# EAGLE design untitled (EAGLE 9.6.2)
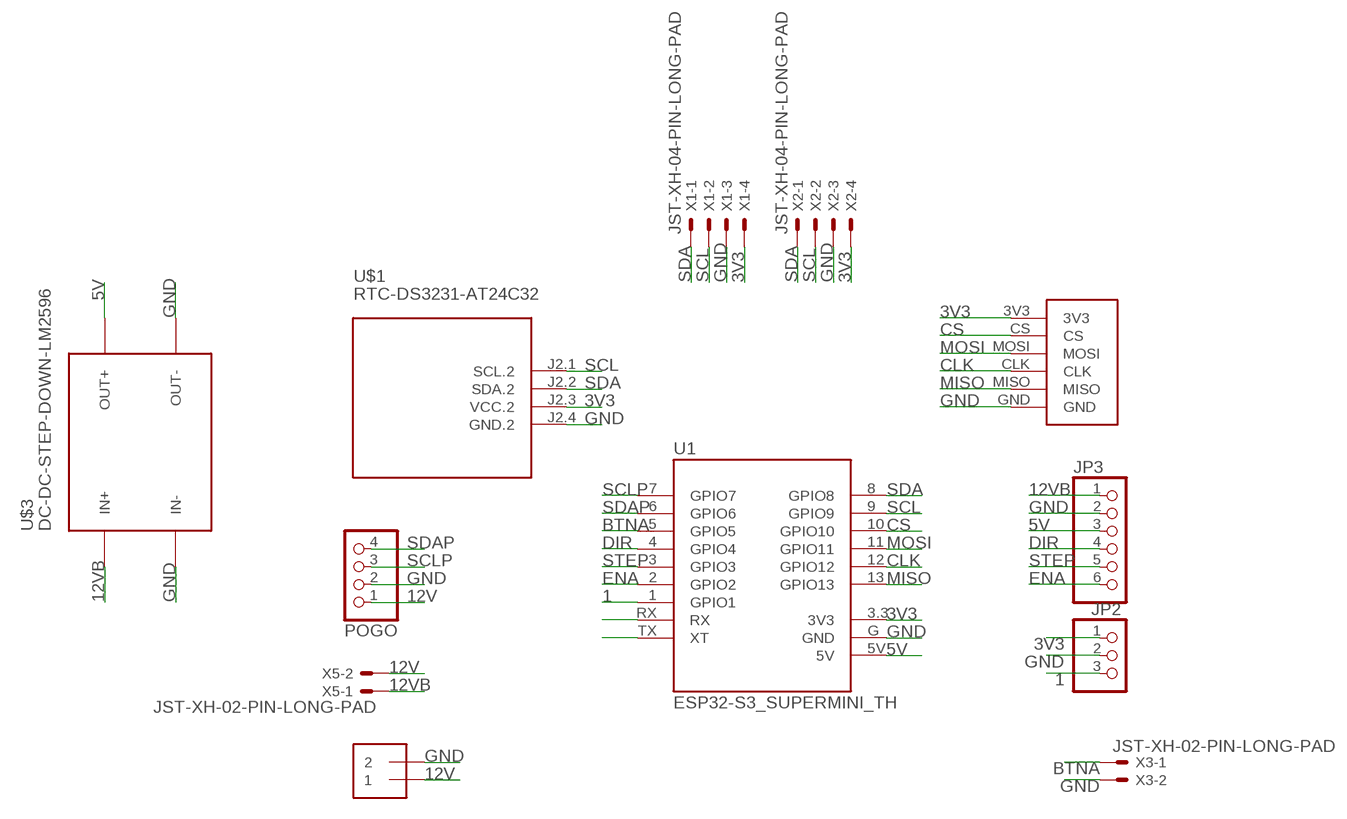
[diagram p0: schematic, sheet 1]

## Parts
J1  1X2-3.5MM  [1X2-3.5MM]
JP2  PINHD-1X3  [1X03]
JP3  PINHD-1X6  [1X06]
POGO  PINHD-1X4  [1X04]
U1  ESP32-S3_SUPERMINI_TH  [MODULE_ESP32-S3_SUPERMINI_TH]
U$1  RTC-DS3231-AT24C32  [RTC-DS3231-AT24C32]
U$2  SD_KUSKALLA  [SD_KUSKALLA]
U$3  DC-DC-STEP-DOWN-LM2596  [DC-DC-STEP-DOWN-LM2596]
X1  JST-XH-04-PIN-LONG-PAD  [JST-XH-04-PACKAGE-LONG-PAD]
X2  JST-XH-04-PIN-LONG-PAD  [JST-XH-04-PACKAGE-LONG-PAD]
X3  JST-XH-02-PIN-LONG-PAD  [JST-XH-02-PACKAGE-LONG-PAD]
X5  JST-XH-02-PIN-LONG-PAD  [JST-XH-02-PACKAGE-LONG-PAD]

## Nets
1: JP2.3 U1.1(GPIO1)
3V3: JP2.1 U1.3.3(3V3) U$1.J2.3(VCC.2) U$2.3V3 X1.4 X2.4
5V: JP3.3 U1.5V U$3.OUT+
12V: J1.1 POGO.1 X5.2
12VB: JP3.1 U$3.IN+ X5.1
BTNA: U1.5(GPIO5) X3.1
CLK: U1.12(GPIO12) U$2.CLK
CS: U1.10(GPIO10) U$2.CS
DIR: JP3.4 U1.4(GPIO4)
ENA: JP3.6 U1.2(GPIO2)
GND: J1.2 JP2.2 JP3.2 POGO.2 U1.G(GND) U$1.J2.4(GND.2) U$2.GND U$3.IN- U$3.OUT- X1.3 X2.3 X3.2
MISO: U1.13(GPIO13) U$2.MISO
MOSI: U1.11(GPIO11) U$2.MOSI
N$8: U1.RX
N$9: U1.TX(XT)
SCL: U1.9(GPIO9) U$1.J2.1(SCL.2) X1.2 X2.2
SCLP: POGO.3 U1.7(GPIO7)
SDA: U1.8(GPIO8) U$1.J2.2(SDA.2) X1.1 X2.1
SDAP: POGO.4 U1.6(GPIO6)
STEP: JP3.5 U1.3(GPIO3)

## Library data of the parts
J1 = adafruit:1X2: 3.5mm Terminal block
JP2 = pinhead:PINHD-1X3: PIN HEADER
JP3 = pinhead:PINHD-1X6: PIN HEADER
POGO = pinhead:PINHD-1X4: PIN HEADER
U1 = ESP32-S3_SUPERMINI_TH:ESP32-S3_SUPERMINI_TH: Biblioteca modificada para esp32 s3 super mini; AVAILABILITY: Not in stock; DESCRIPTION: Super tiny ESP32-S3; MARCA: model S3 esp32; MF: Espressif Systems; MODEL: esp32 S3; MP: ESP32-S3 SuperMini_TH; PACKAGE: Package
U$1 = diy-modules:RTC-DS3231-AT24C32: RTC Module with Battery and EEPROM based on DS3231 and AT24C32 chips Tutorial can be found here: https://edwardmallon.wordpress.com/2014/05/21/using-a-cheap-3-ds3231-rtc-at24c32-eeprom-from-ebay/ Click here to find device on ebay.com
U$2 = SD_KUSKALLA:SD_KUSKALLA
U$3 = diy-modules:DC-DC-STEP-DOWN-LM2596: DC/DC Step-Down Regulator based on LM2596-ADJ chip LM2596 datasheet available here: http://www.ti.com/lit/ds/symlink/lm2596.pdf Click here to find device on ebay.com
X1 X2 = Rembrandt Electronics - JST XH Connectors v1-0:JST-XH-04-PIN: JST XH Connector 2 Pin Wire to board connector. Pitch: 2,54 mm, (0.100") Number of pins: 4 Created by Rembrandt Electronics www.rembrandtelectronics.com
X3 X5 = Rembrandt Electronics - JST XH Connectors v1-0:JST-XH-02-PIN: JST XH Connector 2 Pin

## Board
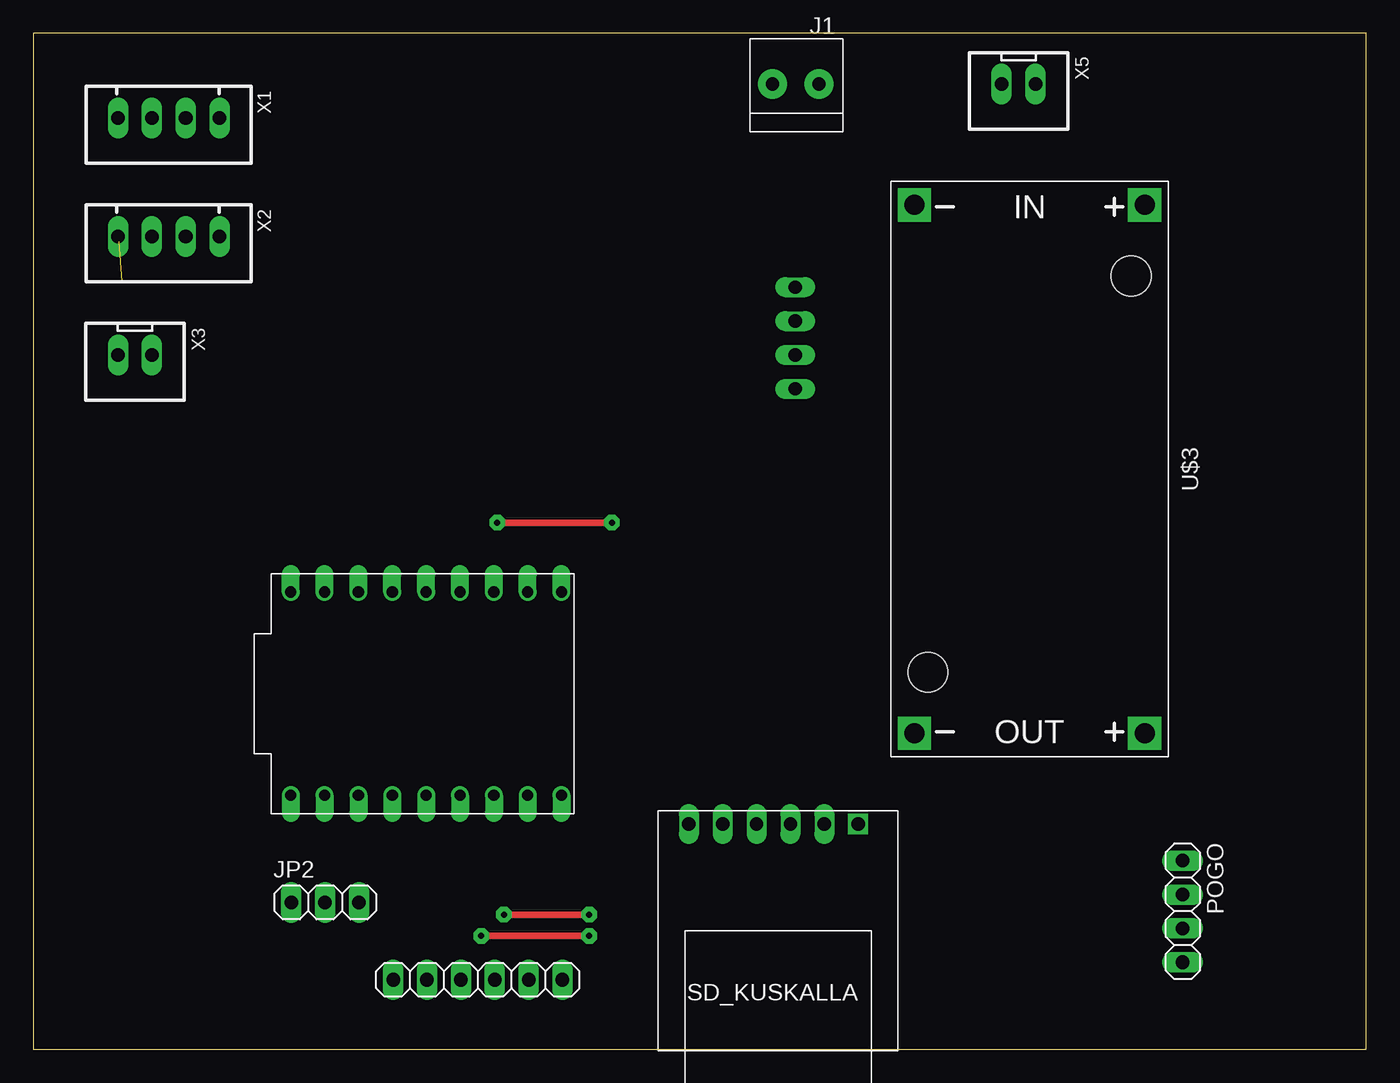
[diagram p1: board, top side]
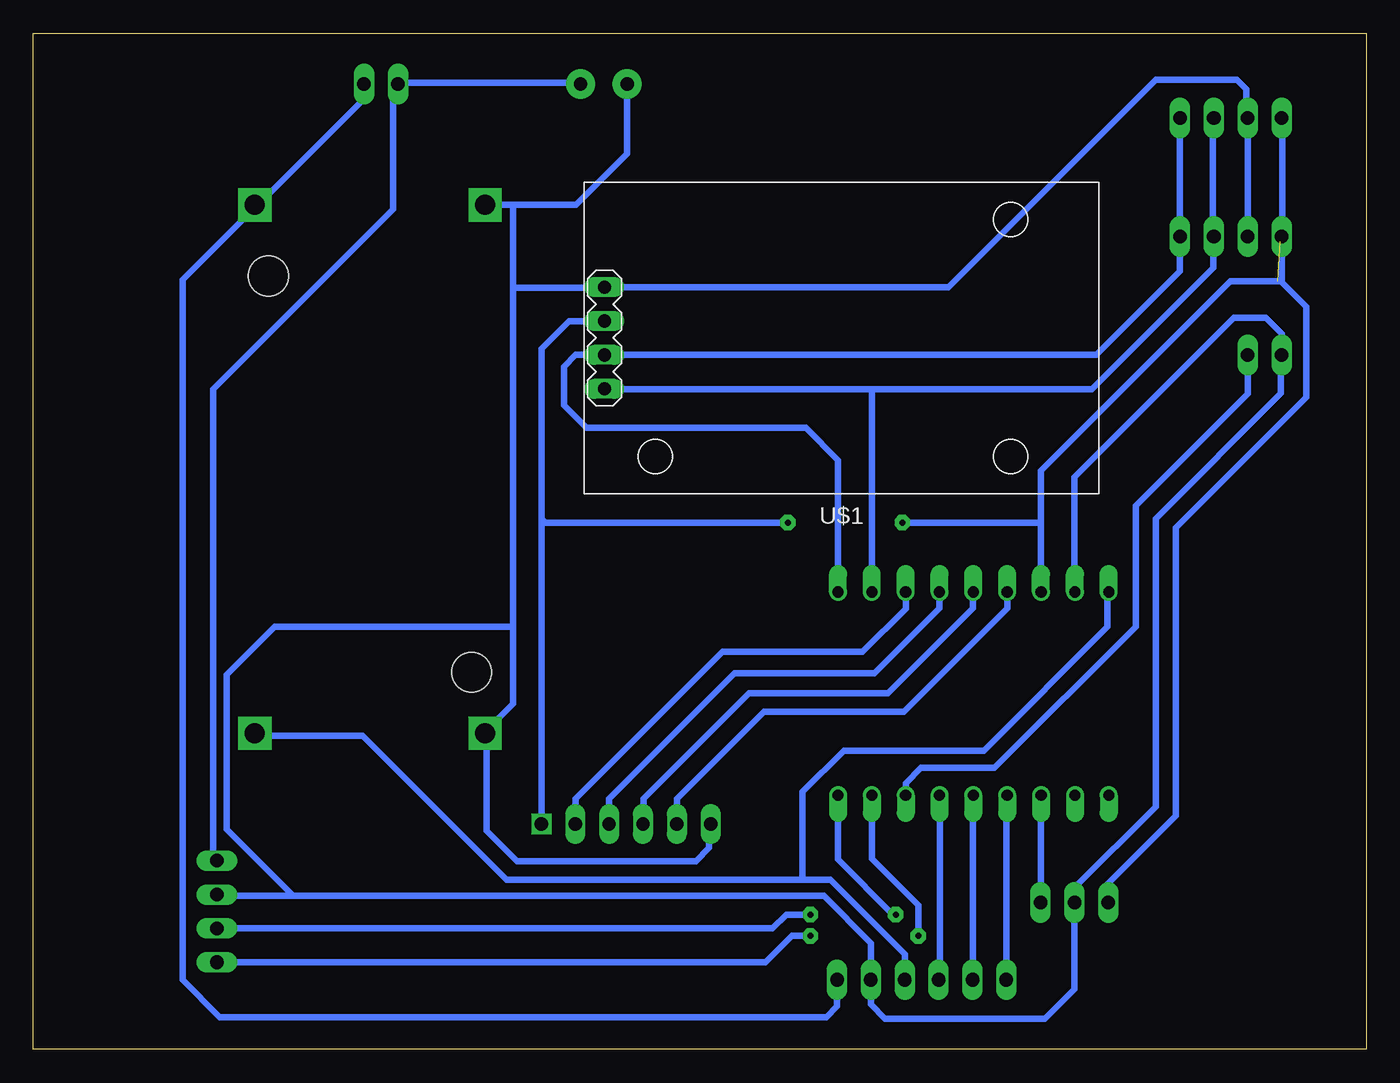
[diagram p2: board, bottom side, seen from below]

Size 100 x 76.19 mm. Coordinates in mm from the lower left corner, seen from the top.
Outline: 0,0 100,0 100,76.19 0,76.19 0,0
Copper layers (1*16): Top 0.035mm / dielectric 1.5mm / Bottom 0.035mm
Design rules "default *": minimum track width 0.5mm, minimum drill 0.35mm, track to track 0.4mm, track to pad 0.4mm, pad to pad 0.4mm, via to via 0.4mm, smd to smd 6mil, copper to edge 40mil, drill to drill 6mil, minimum pad ring 10mil, minimum via ring 8mil, stop-mask expansion 4mil, vias tented up to drill 0mil, thermal gap 10mil

### Footprints (pad centres in the part's own frame; a part is rotated, then mirrored left to right if it is on the bottom)
1X2-3.5MM = drill 1 pad 2.184: 1 1.8,0; 2 -1.7,0
1X03 = drill 1.016 long: 1 -2.54,0; 2 0,0; 3 2.54,0
1X06 = drill 1.016 long: 1 -6.35,0; 2 -3.81,0; 3 -1.27,0; 4 1.27,0; 5 3.81,0; 6 6.35,0
1X04 = drill 1.016 long: 1 -3.81,0; 2 -1.27,0; 3 1.27,0; 4 3.81,0
MODULE_ESP32-S3_SUPERMINI_TH = drill 0.84 offset: 1 -7.62,4.82; 2 -7.62,2.28; 3 -7.62,-0.26; 3.3 7.62,4.82; 4 -7.62,-2.8; 5 -7.62,-5.34; 5V 7.62,9.9; 6 -7.62,-7.88; 7 -7.62,-10.42; 8 7.62,-10.42; 9 7.62,-7.88; 10 7.62,-5.34; 11 7.62,-2.8; 12 7.62,-0.26; 13 7.62,2.28; G 7.62,7.36; RX -7.62,7.36; TX -7.62,9.9
RTC-DS3231-AT24C32 = drill 1 long: J2.1 17.78,3.81; J2.2 17.78,1.27; J2.3 17.78,-1.27; J2.4 17.78,-3.81
SD_KUSKALLA = drill 1 square: 3V3 -8,6 | drill 1 long: CLK -8,-1.62; CS -8,3.46; GND -8,-6.7; MISO -8,-4.16; MOSI -8,0.92
DC-DC-STEP-DOWN-LM2596 = drill 1.5 pad 2.5 square: IN+ -19.812,8.636; IN- -19.812,-8.636; OUT+ 19.812,8.636; OUT- 19.812,-8.636 | hole 3: -14.478,7.62; 15.24,-7.62
JST-XH-04-PACKAGE-LONG-PAD = drill 1.016 long: 1 -3.81,0; 2 -1.27,0; 3 1.27,0; 4 3.81,0
JST-XH-02-PACKAGE-LONG-PAD = drill 1.016 long: 1 -1.27,0; 2 1.27,0

### Placement (x,y rotation side)
J1  57.15,72.39 0 top
JP2  21.89,11.01 0 top
JP3  33.35,5.21 180 top
POGO  86.23,10.33 270 top
U1  29.21,26.67 90 top
U$1  39.37,53.34 180 bottom
U$2  55.88,8.89 270 top
U$3  74.74,43.51 270 top
X1  10.16,69.85 180 top
X2  10.16,60.96 180 top
X3  7.62,52.07 180 top
X5  73.91,72.39 180 top

### Tracks (layer width: path | path; a pad name or v marks a point on that pad's centre or on a via)
1
  Bottom 0.5: U1.1 24.4,11.04 JP2.3
3V3  (via drill 0.45 pad 1.15)  (1 unrouted)
  Top 0.5: v43.4,39.5 v34.8,39.5
  Bottom 0.5: 24.4,39.3 24.4,43.4 10.2,57.6 6.35,57.6 X2.4 | 24.4,39.3 U1.3.3 | 6.45,60.55 6.5,60.5 X2.4 | 57.14,54.6 U$1.J2.3 59.79,54.61 61.88,52.52 61.88,39.8 | 61.88,39.8 U$2.3V3 | JP2.1 19.35,12.46 14.3,17.51 14.3,39.1 4.5,48.9 4.5,55.7 6.4,57.6 6.65,57.6 | X2.4 6.3,61.01 6.3,69.8 X1.4 | 61.88,39.8 61.58,39.5 v43.4,39.5 | v34.8,39.5 24.6,39.5 24.4,39.3
5V
  Bottom 0.5: U1.5V 19.41,34.19 19.41,31.69 28.7,22.4 39.2,22.4 42.3,19.3 42.3,12.7 | JP3.3 34.62,7.12 40.2,12.7 42.3,12.7 | 42.3,12.7 64.5,12.7 75.3,23.5 83,23.5 U$3.OUT+
12V
  Bottom 0.5: POGO.1 86.5,14.5 86.5,49.5 73,63 73,72 X5.2 72.5,72.5 59,72.5 J1.1
12VB
  Bottom 0.5: JP3.1 39.7,3.21 40.5,2.41 86.01,2.41 88.8,5.2 88.8,57.7 83.5,63 U$3.IN+ 83,63.5 75.5,71 75.5,72 X5.1
BTNA
  Bottom 0.5: U1.5 34.55,19.95 33.4,21.1 27.9,21.1 17.3,31.7 17.3,40.76 8.89,49.17 X3.1
CLK
  Bottom 0.5: U1.12 29.51,34.25 29.51,33.09 35.9,26.7 46.3,26.7 54.21,18.79 54.21,16.94 U$2.CLK
CS
  Bottom 0.5: U1.10 34.55,33.05 37.8,29.8 48.3,29.8 59.31,18.79 59.31,16.92 U$2.CS
DIR
  Bottom 0.5: U1.4 32,19 32,5.5 JP3.4
ENA
  Bottom 0.5: JP3.6 27,19 U1.2
GND
  Bottom 0.5: U$2.GND 49.3,16.74 49.3,15.1 50.3,14.1 63.7,14.1 66,16.4 66,23.5 U$3.OUT- 66.05,23.85 64,25.9 64,31.7 | 8.9,69.82 X2.3 | 8.9,69.82 9,69.5 9,72 9.7,72.7 15.8,72.7 31.35,57.15 U$1.J2.4 57.2,57.1 64,57.1 | 8.9,69.82 X1.3 | J1.2 55.45,67.15 59.28,63.32 U$3.IN- 64,63.32 64,57.1 | 64,57.1 64,31.7 | U1.G 21.9,34.34 21.9,42.9 9.93,54.87 7.55,54.87 6.35,53.67 X3.2 6.4,52.05 6.4,49.2 15.8,39.8 15.8,18.18 21.89,12.1 JP2.2 21.89,4.51 24.1,2.3 36.1,2.3 37.16,3.36 JP3.2 37.16,7.96 40.7,11.5 80.5,11.5 | 80.5,11.5 86,11.5 POGO.2 | 64,31.7 81.9,31.7 85.5,28.1 85.5,16.5 80.5,11.5
MISO
  Bottom 0.5: U1.13 26.91,34.27 26.91,33.09 34.7,25.3 45.2,25.3 51.72,18.78 U$2.MISO
MOSI
  Bottom 0.5: U1.11 32.01,33.09 36.9,28.2 47.4,28.2 56.8,18.8 U$2.MOSI
SCL
  Bottom 0.5: 37.2,49.5 37.1,49.4 U1.9 | U$1.J2.1 57,49.5 37.2,49.5 | X1.2 11.5,69.5 11.5,61 X2.2 11.46,60.93 11.46,58.61 20.57,49.5 37.2,49.5
SCLP  (via drill 0.45 pad 1.15)
  Top 0.5: v41.7,10.1 v35.3,10.1
  Bottom 0.5: POGO.3 44.54,9.06 43.5,10.1 v41.7,10.1 | v35.3,10.1 35.5,10.1 39.63,14.23 U1.7
SDA
  Bottom 0.5: U1.8 39.63,44.19 42.04,46.6 58.5,46.6 60.2,48.3 60.2,51.2 59.33,52.07 U$1.J2.2 20.23,52.07 13.97,58.33 X2.1 14,61 14,69.5 X1.1
SDAP  (via drill 0.45 pad 1.15)
  Top 0.5: v41.7,8.5 v33.6,8.5
  Bottom 0.5: POGO.4 45.08,6.52 43.1,8.5 v41.7,8.5 | v33.6,8.5 33.6,10.8 37.09,14.29 U1.6
STEP
  Bottom 0.5: U1.3 29.5,19 29.5,5.5 JP3.5